# Altium schematic sheet Sheet1.SchDoc
size A2; SheetNumber: 1; SheetTotal: 2
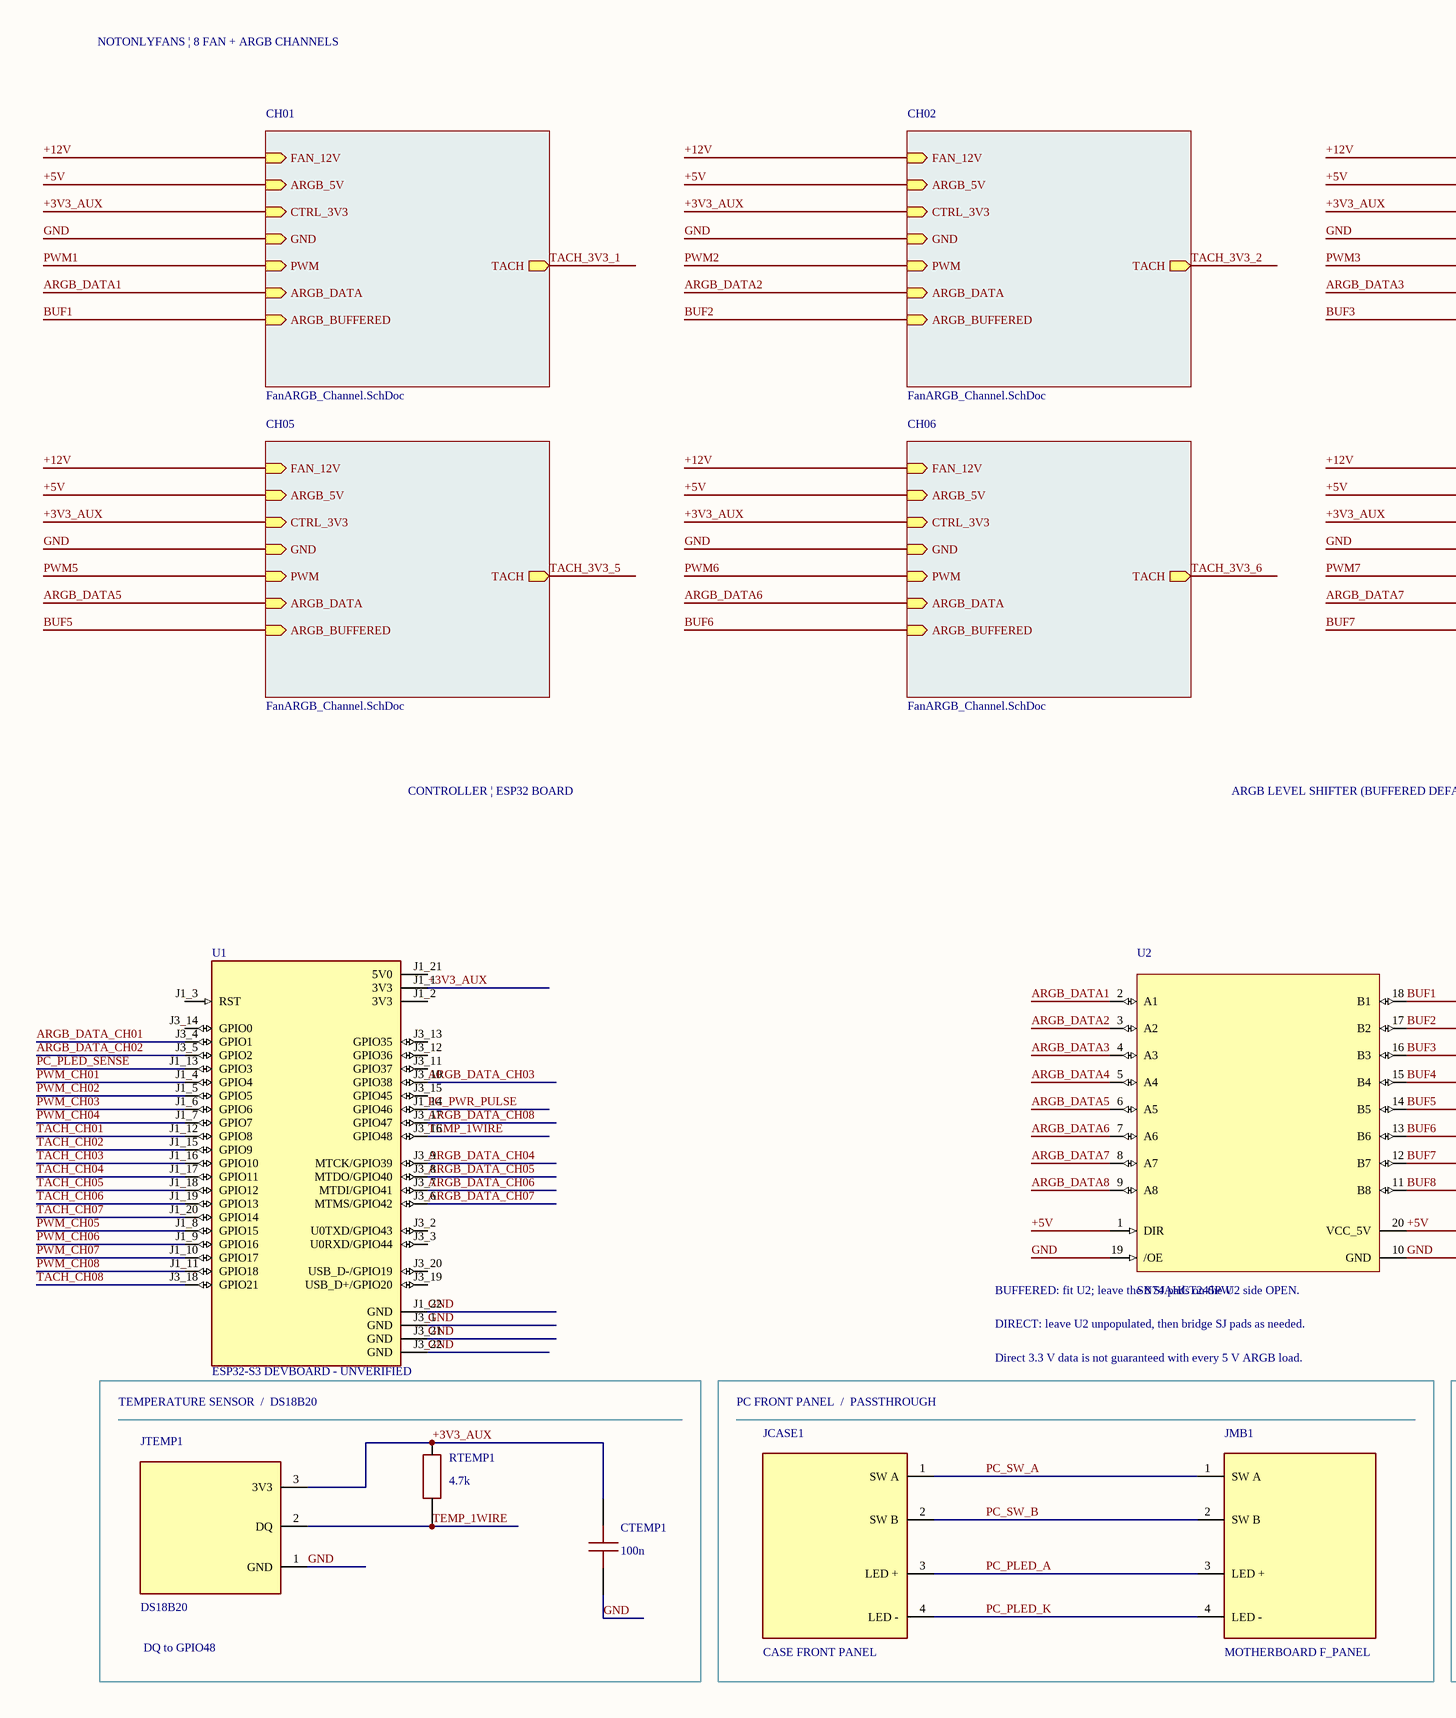
[diagram p0: Sheet1.SchDoc, left]
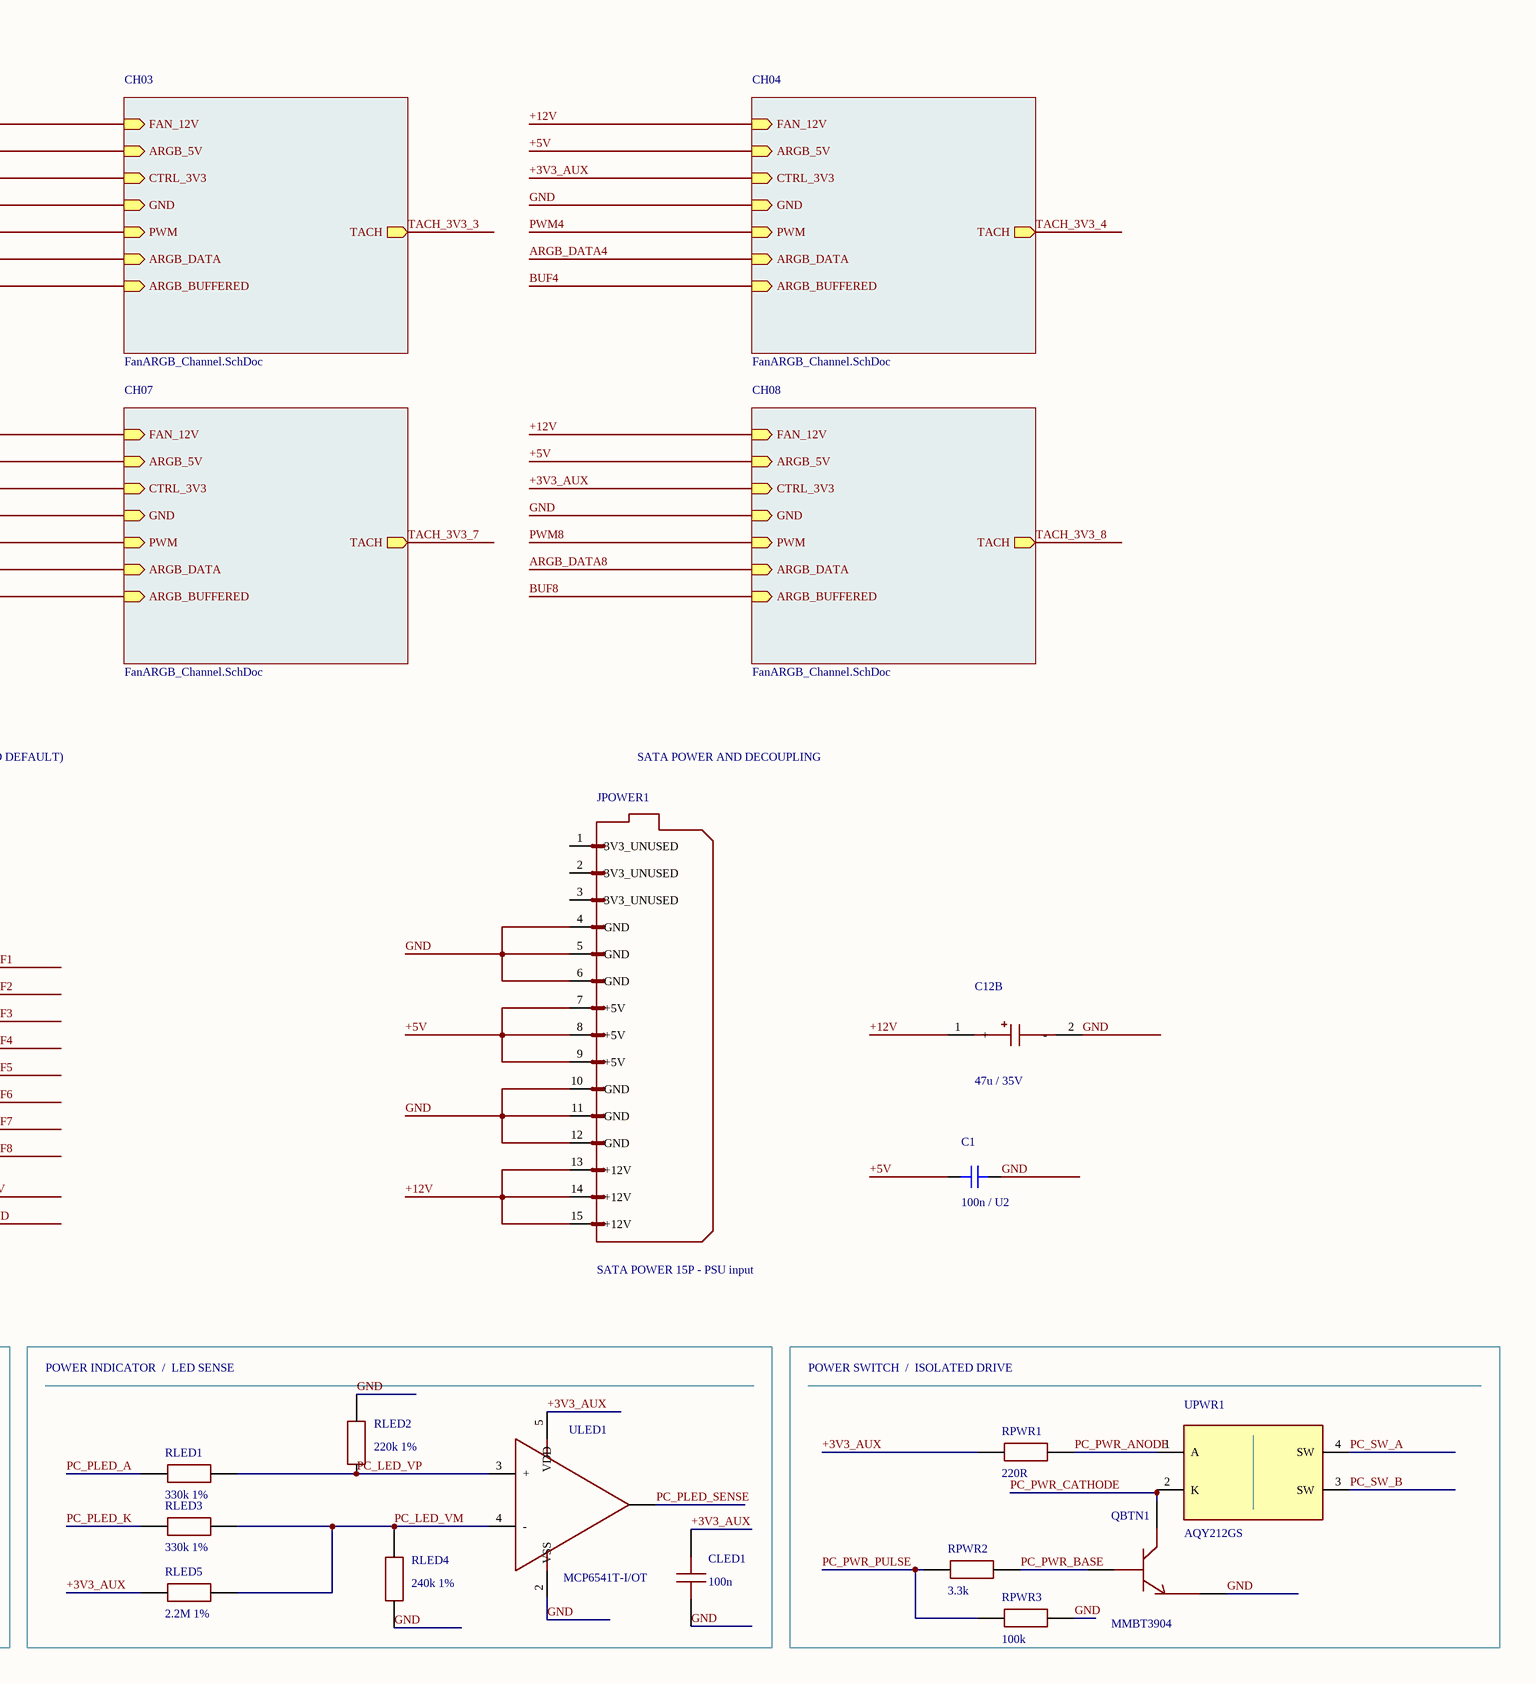
[diagram p1: Sheet1.SchDoc, right]

## Parts
C1  100n / U2  [CH0603C]
C12B  47u / 35V  [EEE_FK_D_6X6]
CLED1  100n  [CH0603C]
CTEMP1  100n  [CH0603C]
JCASE1  CASE FRONT PANEL  [TSW_104_08_S_RA]
JMB1  MOTHERBOARD F_PANEL  [TSW_104_08_S_RA]
JPOWER1  SATA POWER 15P - PSU input  [CSAT-M15RD30-PB]
JTEMP1  DS18B20  [B3B_PH_K_S_1X03]
QBTN1  MMBT3904  [MMBT3904_SOT23]
RLED1  330k 1%  [CH0603R]
RLED2  220k 1%  [CH0603R]
RLED3  330k 1%  [CH0603R]
RLED4  240k 1%  [CH0603R]
RLED5  2.2M 1%  [CH0603R]
RPWR1  220R  [CH0603R]
RPWR2  3.3k  [CH0603R]
RPWR3  100k  [CH0603R]
RTEMP1  4.7k  [CH0603R]
U1  ESP32-S3 DEVBOARD - UNVERIFIED  [YD-ESP32-S3_44P_25.40MM]
U2  SN74AHCT245PW  [TI TSSOP-20 PW]
ULED1  MCP6541T-I/OT  [SOT23_5_AUX]
UPWR1  AQY212GS  [AQY212GS_SOP4]

## Blocks framed on the sheet
PC FRONT PANEL  /  PASSTHROUGH: JCASE1 JMB1
POWER INDICATOR  /  LED SENSE: CLED1 RLED1-RLED5 ULED1
POWER SWITCH  /  ISOLATED DRIVE: QBTN1 RPWR1-RPWR3 UPWR1

## Sub-sheets
CH01 = FanARGB_Channel.SchDoc: FAN_12V (in), ARGB_5V (in), CTRL_3V3 (in), GND (in), PWM (in), ARGB_DATA (in), ARGB_BUFFERED (in), TACH (out)
CH02 = FanARGB_Channel.SchDoc: FAN_12V (in), ARGB_5V (in), CTRL_3V3 (in), GND (in), PWM (in), ARGB_DATA (in), ARGB_BUFFERED (in), TACH (out)
CH03 = FanARGB_Channel.SchDoc: FAN_12V (in), ARGB_5V (in), CTRL_3V3 (in), GND (in), PWM (in), ARGB_DATA (in), ARGB_BUFFERED (in), TACH (out)
CH04 = FanARGB_Channel.SchDoc: FAN_12V (in), ARGB_5V (in), CTRL_3V3 (in), GND (in), PWM (in), ARGB_DATA (in), ARGB_BUFFERED (in), TACH (out)
CH05 = FanARGB_Channel.SchDoc: FAN_12V (in), ARGB_5V (in), CTRL_3V3 (in), GND (in), PWM (in), ARGB_DATA (in), ARGB_BUFFERED (in), TACH (out)
CH06 = FanARGB_Channel.SchDoc: FAN_12V (in), ARGB_5V (in), CTRL_3V3 (in), GND (in), PWM (in), ARGB_DATA (in), ARGB_BUFFERED (in), TACH (out)
CH07 = FanARGB_Channel.SchDoc: FAN_12V (in), ARGB_5V (in), CTRL_3V3 (in), GND (in), PWM (in), ARGB_DATA (in), ARGB_BUFFERED (in), TACH (out)
CH08 = FanARGB_Channel.SchDoc: FAN_12V (in), ARGB_5V (in), CTRL_3V3 (in), GND (in), PWM (in), ARGB_DATA (in), ARGB_BUFFERED (in), TACH (out)

## Nets
+3V3_AUX: CLED1.1 CTEMP1.1 JTEMP1.3(3V3) RLED5.1 RPWR1.1 RTEMP1.1 U1.J1_1(3V3) ULED1.5(VDD) ; sheet CH01/CTRL_3V3, sheet CH02/CTRL_3V3, sheet CH03/CTRL_3V3, sheet CH04/CTRL_3V3, sheet CH05/CTRL_3V3, sheet CH06/CTRL_3V3, sheet CH07/CTRL_3V3, sheet CH08/CTRL_3V3
+5V: C1.1 JPOWER1.7(+5V) JPOWER1.8(+5V) JPOWER1.9(+5V) U2.1(DIR) U2.20(VCC_5V) ; sheet CH01/ARGB_5V, sheet CH02/ARGB_5V, sheet CH03/ARGB_5V, sheet CH04/ARGB_5V, sheet CH05/ARGB_5V, sheet CH06/ARGB_5V, sheet CH07/ARGB_5V, sheet CH08/ARGB_5V
+12V: C12B.1(+) JPOWER1.13(+12V) JPOWER1.14(+12V) JPOWER1.15(+12V) ; sheet CH01/FAN_12V, sheet CH02/FAN_12V, sheet CH03/FAN_12V, sheet CH04/FAN_12V, sheet CH05/FAN_12V, sheet CH06/FAN_12V, sheet CH07/FAN_12V, sheet CH08/FAN_12V
ARGB_DATA1: U2.2(A1) ; sheet CH01/ARGB_DATA
ARGB_DATA2: U2.3(A2) ; sheet CH02/ARGB_DATA
ARGB_DATA3: U2.4(A3) ; sheet CH03/ARGB_DATA
ARGB_DATA4: U2.5(A4) ; sheet CH04/ARGB_DATA
ARGB_DATA5: U2.6(A5) ; sheet CH05/ARGB_DATA
ARGB_DATA6: U2.7(A6) ; sheet CH06/ARGB_DATA
ARGB_DATA7: U2.8(A7) ; sheet CH07/ARGB_DATA
ARGB_DATA8: U2.9(A8) ; sheet CH08/ARGB_DATA
ARGB_DATA_CH01: U1.J3_4(GPIO1)
ARGB_DATA_CH02: U1.J3_5(GPIO2)
ARGB_DATA_CH03: U1.J3_10(GPIO38)
ARGB_DATA_CH04: U1.J3_9(MTCK/GPIO39)
ARGB_DATA_CH05: U1.J3_8(MTDO/GPIO40)
ARGB_DATA_CH06: U1.J3_7(MTDI/GPIO41)
ARGB_DATA_CH07: U1.J3_6(MTMS/GPIO42)
ARGB_DATA_CH08: U1.J3_17(GPIO47)
BUF1: U2.18(B1) ; sheet CH01/ARGB_BUFFERED
BUF2: U2.17(B2) ; sheet CH02/ARGB_BUFFERED
BUF3: U2.16(B3) ; sheet CH03/ARGB_BUFFERED
BUF4: U2.15(B4) ; sheet CH04/ARGB_BUFFERED
BUF5: U2.14(B5) ; sheet CH05/ARGB_BUFFERED
BUF6: U2.13(B6) ; sheet CH06/ARGB_BUFFERED
BUF7: U2.12(B7) ; sheet CH07/ARGB_BUFFERED
BUF8: U2.11(B8) ; sheet CH08/ARGB_BUFFERED
GND: C1.2 C12B.2(-) CLED1.2 CTEMP1.2 JPOWER1.4(GND) JPOWER1.5(GND) JPOWER1.6(GND) JPOWER1.10(GND) JPOWER1.11(GND) JPOWER1.12(GND) JTEMP1.1(GND) QBTN1.2 RLED2.2 RLED4.2 RPWR3.2 U1.J1_22(GND) U1.J3_1(GND) U1.J3_21(GND) U1.J3_22(GND) U2.10(GND) U2.19(/OE) ULED1.2(VSS) ; sheet CH01/GND, sheet CH02/GND, sheet CH03/GND, sheet CH04/GND, sheet CH05/GND, sheet CH06/GND, sheet CH07/GND, sheet CH08/GND
PC_LED_VM: RLED3.2 RLED4.1 RLED5.2 ULED1.4(-)
PC_LED_VP: RLED1.2 RLED2.1 ULED1.3(+)
PC_PLED_A: JCASE1.3(LED_+) JMB1.3(LED_+) RLED1.1
PC_PLED_K: JCASE1.4(LED_-) JMB1.4(LED_-) RLED3.1
PC_PLED_SENSE: U1.J1_13(GPIO3) ULED1.1
PC_PWR_ANODE: RPWR1.2 UPWR1.1(A)
PC_PWR_BASE: QBTN1.1 RPWR2.2
PC_PWR_CATHODE: QBTN1.3 UPWR1.2(K)
PC_PWR_PULSE: RPWR2.1 RPWR3.1 U1.J1_14(GPIO46)
PC_SW_A: JCASE1.1(SW_A) JMB1.1(SW_A) UPWR1.4(SW)
PC_SW_B: JCASE1.2(SW_B) JMB1.2(SW_B) UPWR1.3(SW)
PWM1: sheet CH01/PWM
PWM2: sheet CH02/PWM
PWM3: sheet CH03/PWM
PWM4: sheet CH04/PWM
PWM5: sheet CH05/PWM
PWM6: sheet CH06/PWM
PWM7: sheet CH07/PWM
PWM8: sheet CH08/PWM
PWM_CH01: U1.J1_4(GPIO4)
PWM_CH02: U1.J1_5(GPIO5)
PWM_CH03: U1.J1_6(GPIO6)
PWM_CH04: U1.J1_7(GPIO7)
PWM_CH05: U1.J1_8(GPIO15)
PWM_CH06: U1.J1_9(GPIO16)
PWM_CH07: U1.J1_10(GPIO17)
PWM_CH08: U1.J1_11(GPIO18)
TACH_3V3_1: sheet CH01/TACH
TACH_3V3_2: sheet CH02/TACH
TACH_3V3_3: sheet CH03/TACH
TACH_3V3_4: sheet CH04/TACH
TACH_3V3_5: sheet CH05/TACH
TACH_3V3_6: sheet CH06/TACH
TACH_3V3_7: sheet CH07/TACH
TACH_3V3_8: sheet CH08/TACH
TACH_CH01: U1.J1_12(GPIO8)
TACH_CH02: U1.J1_15(GPIO9)
TACH_CH03: U1.J1_16(GPIO10)
TACH_CH04: U1.J1_17(GPIO11)
TACH_CH05: U1.J1_18(GPIO12)
TACH_CH06: U1.J1_19(GPIO13)
TACH_CH07: U1.J1_20(GPIO14)
TACH_CH08: U1.J3_18(GPIO21)
TEMP_1WIRE: JTEMP1.2(DQ) RTEMP1.2 U1.J3_16(GPIO48)

Not connected (* = marked no-connect by the designer): JPOWER1 1(3V3_UNUSED) 2(3V3_UNUSED) 3(3V3_UNUSED); U1 J1_2(3V3) J1_3(RST) J1_21(5V0) J3_2(U0TXD/GPIO43) J3_3(U0RXD/GPIO44) J3_11(GPIO37) J3_12(GPIO36) J3_13(GPIO35) J3_14(GPIO0) J3_15(GPIO45) J3_19(USB_D+/GPIO20) J3_20(USB_D-/GPIO19)

## Notes on the sheet
- NOTONLYFANS | 8 FAN + ARGB CHANNELS
- CONTROLLER | ESP32 BOARD
- ARGB LEVEL SHIFTER (BUFFERED DEFAULT)
- SATA POWER AND DECOUPLING
- (near U2) BUFFERED: fit U2; leave the 8 SJ pads on the U2 side OPEN.
- DIRECT: leave U2 unpopulated, then bridge SJ pads as needed.
- Direct 3.3 V data is not guaranteed with every 5 V ARGB load.
- (near U1) TEMPERATURE SENSOR  /  DS18B20
- DQ to GPIO48

## Library data of the parts
C1 = Capacitor: 100nF U2 bypass per TI section 9.3; connect +5V to GND, place close to U2 VCC/GND in future PCB; voltage rating and package TBD.
C12B = AUTHORED_POLAR_C: AUTHORED native symbol; verified electrical pin IDs per tools/PWM_TOPOLOGY.md; no approved footprint; Manufacturer Part Number: EEE-FK1V470P; Provenance: AUTHORED; datasheet pin identity in tools/PWM_TOPOLOGY.md
CLED1 CTEMP1 = CAP_100n
JCASE1 JMB1 = TSW-104-07-T-S: Manufacturer Part Number: TSW-104-08-T-S-RA
JPOWER1 = CUSTOM_SATA_POWER_15: Conn-Link CSAT-M15RD30-PB, 15-pin SATA power input, right-angle through-hole plug.
JTEMP1 = B3B-PH-K-S(LF)(SN): Manufacturer Part Number: B3B-PH-K-S(LF)(SN)
QBTN1 = MMBT3904LT1G: Manufacturer Part Number: MMBT3904LT1G
RLED1 RLED3 = RES_330k_1%
RLED2 = RES_220k_1%
RLED4 = RES_240k_1%
RLED5 = RES_2.2M_1%
RPWR1 = RES_220R
RPWR2 = RES_3.3k
RPWR3 = RES_100k
RTEMP1 = RES_4.7k
U1 = ESP32-S3-DEVKITC-1-N16R8V: Existing DevKitC symbol retained only as provisional whole-board stand-in. Twin-USB-C board identity, header pinout and footprint UNVERIFIED.; MF: Espressif Systems; SnapEDA_Link: https://www.snapeda.com/parts/ESP32-S3-DEVKITC-1-N16R8V/Espressif+Systems/view-part/?ref=snap; Package: None; Value: *; MP: ESP32-S3-DEVKITC-1-N16R8V; Check_prices: https://www.snapeda.com/parts/ESP32-S3-DEVKITC-1-N16R8V/Espressif+Systems/view-part/?ref=eda
U2 = CUSTOM_SN74AHCT245: Default ARGB buffer. Leave the eight top-side SJ bridges open when U2 is fitted.; DefaultPopulation: FITTED; AssemblyOption: BUFFERED only; every SJ open
ULED1 = MCP6541T-I/OT: Manufacturer Part Number: MCP6541T-I/OT
UPWR1 = AQY212GS: Manufacturer Part Number: AQY212GS